# Altium schematic sheet esp32p10displaySheet4.SchDoc
size A4; SheetNumber: 4; SheetTotal: 4
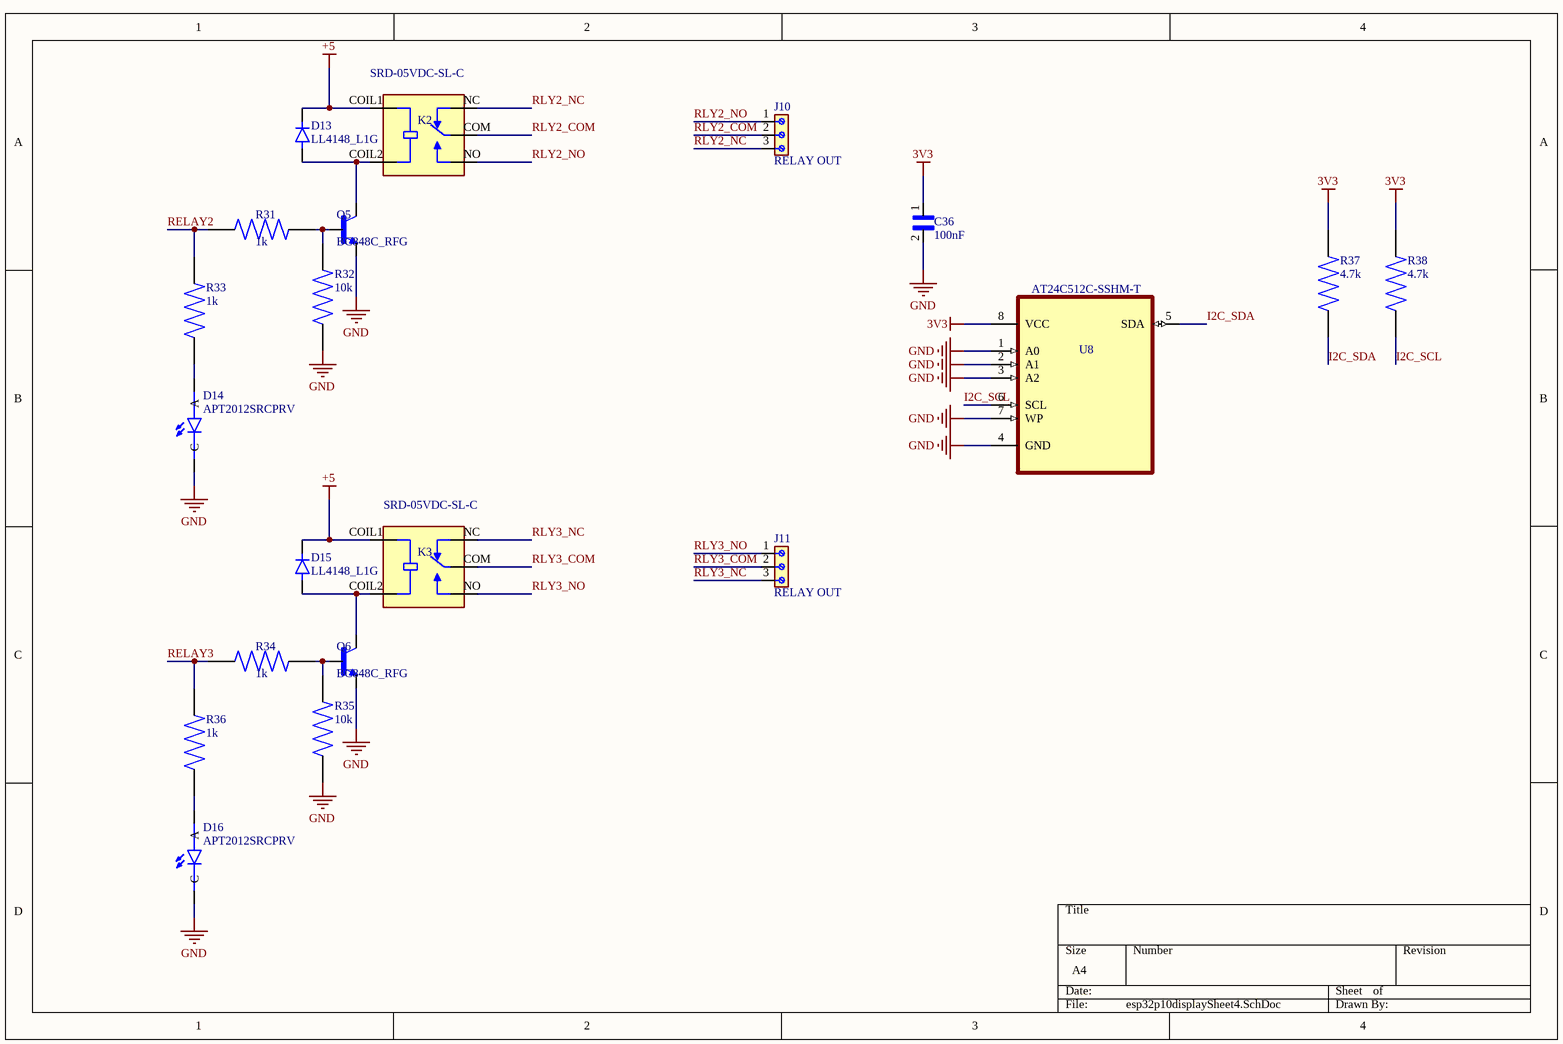
[diagram p0: esp32p10displaySheet4.SchDoc]

## Parts
C36  100nF  [CAPC2012X140N]
D13  LL4148_L1G  [DIOMELF3515N]
D14  APT2012SRCPRV  [LEDC2012X75N]
D15  LL4148_L1G  [DIOMELF3515N]
D16  APT2012SRCPRV  [LEDC2012X75N]
J10  RELAY OUT  [691236510003]
J11  RELAY OUT  [691236510003]
K2  SRD-05VDC-SL-C  [RELAY_SRD-03VDC-SL-C]
K3  SRD-05VDC-SL-C  [RELAY_SRD-03VDC-SL-C]
Q5  BC848C_RFG  [SOT95P237X112-3N]
Q6  BC848C_RFG  [SOT95P237X112-3N]
R31  1k  [RES_ERA6VRB1002V]
R32  10k  [RES_ERA6VRB1002V]
R33  1k  [RES_ERA6VRB1002V]
R34  1k  [RES_ERA6VRB1002V]
R35  10k  [RES_ERA6VRB1002V]
R36  1k  [RES_ERA6VRB1002V]
R37  4.7k  [RES_ERA6VRB1002V]
R38  4.7k  [RES_ERA6VRB1002V]
U8  AT24C512C-SSHM-T  [SOIC127P600X175-8N]

## Nets
3V3: C36.1 R37.2 R38.2 U8.8(VCC)
+5: D13.C(K) D15.C(K) K2.COIL1 K3.COIL1
GND: C36.2 D14.C D16.C Q5.2(E) Q6.2(E) R32.1 R35.1 U8.1(A0) U8.2(A1) U8.3(A2) U8.4(GND) U8.7(WP)
I2C_SCL: R38.1 U8.6(SCL)
I2C_SDA: R37.1 U8.5(SDA)
RELAY2: R31.1 R33.2
RELAY3: R34.1 R36.2
RLY2_COM: J10.2 K2.COM
RLY2_NC: J10.3 K2.NC
RLY2_NO: J10.1 K2.NO
RLY3_COM: J11.2 K3.COM
RLY3_NC: J11.3 K3.NC
RLY3_NO: J11.1 K3.NO
NetD13_A: D13.A K2.COIL2 Q5.3(C)
NetD14_A: D14.A R33.1
NetD15_A: D15.A K3.COIL2 Q6.3(C)
NetD16_A: D16.A R36.1
NetQ5_1: Q5.1(B) R31.2 R32.2
NetQ6_1: Q6.1(B) R34.2 R35.2

## Library data of the parts
C36 = CL21B104KCFNNNE: 0.1 ÂµF Â±10% 100V Ceramic Capacitor X7R 0805 (2012 Metric); MF: Samsung; Purchase-URL: https://pricing.snapeda.com/search?q=CL21B104KCFNNNE&ref=eda; Package: 0805 Samsung; Check_prices: https://www.snapeda.com/parts/CL21B104KCFNNNE/Samsung+Electro-Mechanics/view-part/?ref=eda; Value: *; SnapEDA_Link: https://www.snapeda.com/parts/CL21B104KCFNNNE/Samsung+Electro-Mechanics/view-part/?ref=snap; MP: CL21B104KCFNNNE; Digi-Key_Part_Number: 1276-6840-2-ND
D14 D16 = APT2012SRCPRV: Red 640nm LED Indication - Discrete 1.85V 0805 (2012 Metric); MF: Kingbright; SnapEDA_Link: https://www.snapeda.com/parts/APT2012SRCPRV/Kingbright/view-part/?ref=snap; Package: 0805 Kingbright; Value: *; MP: APT2012SRCPRV; Check_prices: https://www.snapeda.com/parts/APT2012SRCPRV/Kingbright/view-part/?ref=eda
J10 J11 = 691236510003: 3 Position Wire to Board Terminal Block Horizontal with Board 0.200 (5.08mm) Through Hole; MF: WÃ¼rth Elektronik; SnapEDA_Link: https://www.snapeda.com/parts/691236510003/W%25C3%25BCrth+Elektronik+Midcom/view-part/?ref=snap; Package: None; Value: *; MP: 691236510003; Check_prices: https://www.snapeda.com/parts/691236510003/W%25C3%25BCrth+Elektronik+Midcom/view-part/?ref=eda
K2 K3 = SRD-03VDC-SL-C: Relays General Purpose Non Latching 3VDC SPDT 10A (250VAC) Max 5PIN; Manufacturer: Songle; MF: Songle Relay; SnapEDA_Link: https://www.snapeda.com/parts/SRD-03VDC-SL-C/Songle+Relay/view-part/?ref=snap; Package: NON STANDARD-5 Songle Relay; Value: *; MP: SRD-05VDC-SL-C; Check_prices: https://www.snapeda.com/parts/SRD-03VDC-SL-C/Songle+Relay/view-part/?ref=eda
Q5 Q6 = BC848C_RFG: SOT-23, 30V, 0.1A, NPN Transistor; MF: Taiwan Semiconductor; MP: BC848C RFG; SnapEDA_Link: https://www.snapeda.com/parts/BC848C%20RFG/Taiwan+Semiconductor/view-part/?ref=snap; Package: SOT-23 Taiwan Semiconductor; Value: *; Check_prices: https://www.snapeda.com/parts/BC848C%20RFG/Taiwan+Semiconductor/view-part/?ref=eda
R31 R33 R34 R36 = ERA6VRB1002V: MP: ERA6VRB1001V; Availability: Unavailable; Package: None; Value: *; Price: None
R32 R35 = ERA6VRB1002V: Availability: Unavailable; Package: None; MP: ERA6VRB1002V; Value: *; Price: None
R37 R38 = ERA6VRB1002V: MP: ERA6VRB4701V; Availability: Unavailable; Package: None; Value: 4.7k; Price: None
U8 = AT24C512C-SSHM-T: EEPROM Memory IC 512Kb (64K x 8) IÂ²C 400 kHz 900 ns 8-SOIC; MF: Microchip; SnapEDA_Link: https://www.snapeda.com/parts/AT24C512C-SSHM-T/Microchip/view-part/?ref=snap; Package: SO-8 Microchip; Value: *; MP: AT24C512C-SSHM-T; Check_prices: https://www.snapeda.com/parts/AT24C512C-SSHM-T/Microchip/view-part/?ref=eda
D13 D15 = LL4148_L1G: MP: LL4148_L1G; Price: None; Package: None; Availability: Unavailable; Value: *